# Altium project RK3566_.PrjPcb (part 5 of 6)

## Sheet 以太网 PHY_以太网_WIFIBT IO.schdoc
size 297 x 209 mm; Symbol: Drawing-Symbol_A4; Company: 嘉立创EDA; Version: V1.0; Page Size: A4; @Project Name: RK3566; @Update Date: 2026-10-03; @Create Date: 2026-05-25; Device: Drawing-Symbol_A4; @Board Name: Board1; @Page Name: P2; @Create Time: 23:14:39; @Page Count: 5; @Page No: 5; @Schematic Name: Schematic1; @Update Time: 23:14:39; @Assembly Variant: Basic; Border: 1; Title Block Position: 3; Size: A4; Width: 1170; Height: 825; Region Start: 1; X Region Count: 6; Y Region Count: 4; Blade Width: 10; SheetNumber: 10; SheetTotal: 11
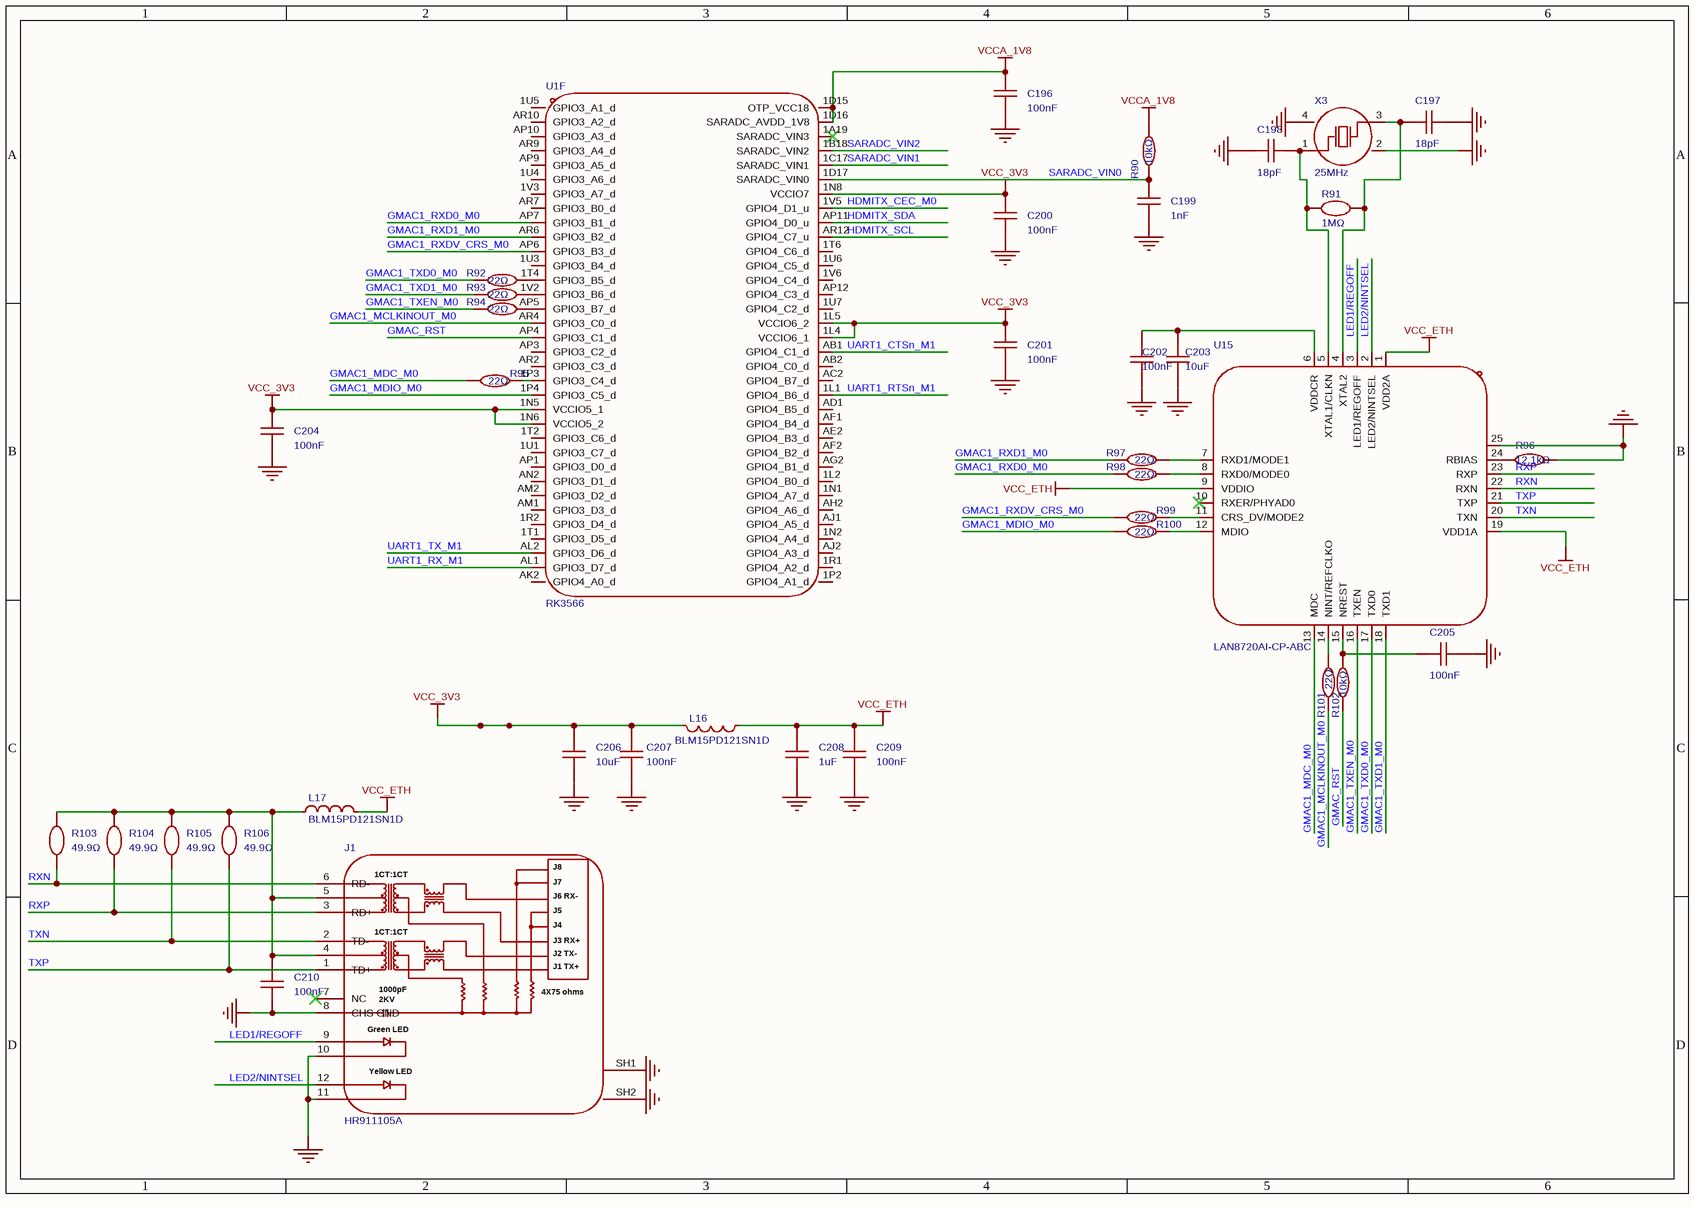
[diagram p11: 以太网 PHY_以太网_WIFIBT IO.schdoc]

### Parts
C196  100nF  [C0201]
C197  18pF  [C0402]
C198  18pF  [C0402]
C199  1nF  [C0402]
C200  100nF  [C0201]
C201  100nF  [C0201]
C202  100nF  [C0402]
C203  10uF  [C0402]
C204  100nF  [C0201]
C205  100nF  [C0402]
C206  10uF  [C0402]
C207  100nF  [C0402]
C208  1uF  [C0402]
C209  100nF  [C0402]
C210  100nF  [C0402]
J1  HR911105A  [RJ45-TH_HR911105A]
L16  BLM15PD121SN1D  [L0402]
L17  BLM15PD121SN1D  [L0402]
R90  10kΩ  [R0402]
R91  1MΩ  [R0402]
R92  22Ω  [R0402]
R93  22Ω  [R0402]
R94  22Ω  [R0402]
R95  22Ω  [R0402]
R96  12.1kΩ  [R0402]
R97  22Ω  [R0402]
R98  22Ω  [R0402]
R99  22Ω  [R0402]
R100  22Ω  [R0402]
R101  22Ω  [R0402]
R102  10kΩ  [R0402]
R103  49.9Ω  [R0402]
R104  49.9Ω  [R0402]
R105  49.9Ω  [R0402]
R106  49.9Ω  [R0402]
U1  RK3566  [BGA-565_L15.5-W14.4-P0.40_RK3566_1]  (part F of 8)
U15  LAN8720AI-CP-ABC  [QFN-24_L4.0-W4.0-P0.50-BL-EP2.6]
X3  25MHz  [CRYSTAL-SMD_4P-L3.2-W2.5-BL]

### Nets
GND: C196.1 C197.2 C198.1 C199.1 C200.1 C201.1 C202.1 C203.1 C204.1 C205.1 C206.1 C207.1 C208.1 C209.2 C210.2 J1.8(CHS_GND) J1.10 J1.11 J1.SH1 J1.SH2 R96.2 U15.25(PAD) X3.2(GND) X3.4(GND)  [project net AVSS1_1]
VCC_3V3: C200.2 C201.2 C204.2 C206.2 C207.2 L16.2 U1.1L4(VCCIO6_1) U1.1L5(VCCIO6_2) U1.1N5(VCCIO5_1) U1.1N6(VCCIO5_2) U1.1N8(VCCIO7)  [project net SWOUT1]
VCC_ETH: C208.2 C209.1 L16.1 L17.2 U15.1(VDD2A) U15.9(VDDIO) U15.19(VDD1A)
VCCA_1V8: C196.2 R90.1 U1.1D15(OTP_VCC18) U1.1D16(SARADC_AVDD_1V8)  [project net LDO7]
GMAC1_MCLKINOUT_M0: R101.1 U1.AR4(GPIO3_C0_d)
GMAC1_MDC_M0: R95.2 U15.13(MDC)
GMAC1_MDIO_M0: R100.2 U1.1P4(GPIO3_C5_d)
GMAC1_RXD0_M0: R98.1 U1.AP7(GPIO3_B1_d)
GMAC1_RXD1_M0: R97.1 U1.AR6(GPIO3_B2_d)
GMAC1_RXDV_CRS_M0: R99.2 U1.AP6(GPIO3_B3_d)
GMAC1_TXD0_M0: R92.1 U15.17(TXD0)
GMAC1_TXD1_M0: R93.1 U15.18(TXD1)
GMAC1_TXEN_M0: R94.1 U15.16(TXEN)
GMAC_RST: R102.2 U1.AP4(GPIO3_C1_d)
HDMITX_CEC_M0: U1.1V5(GPIO4_D1_u)
HDMITX_SCL: U1.AR12(GPIO4_C7_u)
HDMITX_SDA: U1.AP11(GPIO4_D0_u)
LED1/REGOFF: J1.9 U15.3(LED1/REGOFF)
LED2/NINTSEL: J1.12 U15.2(LED2/NINTSEL)
RXN: J1.6(RD-) R103.1 U15.22(RXN)
RXP: J1.3(RD+) R104.1 U15.23(RXP)
SARADC_VIN0: C199.2 R90.2 U1.1D17(SARADC_VIN0)
SARADC_VIN1: U1.1C17(SARADC_VIN1)
SARADC_VIN2: U1.1B18(SARADC_VIN2)
TXN: J1.2(TD-) R105.1 U15.20(TXN)
TXP: J1.1(TD+) R106.1 U15.21(TXP)
UART1_CTSn_M1: U1.AB1(GPIO4_C1_d)
UART1_RTSn_M1: U1.1L1(GPIO4_B6_d)
UART1_RX_M1: U1.AL1(GPIO3_D7_d)
UART1_TX_M1: U1.AL2(GPIO3_D6_d)
NetC197_1: C197.1 R91.2 U15.4(XTAL2) X3.3(OSC2)
NetC198_2: C198.2 R91.1 U15.5(XTAL1/CLKN) X3.1(OSC1)
NetC202_2: C202.2 C203.2 U15.6(VDDCR)
NetC205_2: C205.2 R102.1 U15.15(NREST)
NetC210_1: C210.1 J1.4 J1.5 L17.1 R103.2 R104.2 R105.2 R106.2
NetR92_2: R92.2 U1.1T4(GPIO3_B5_d)
NetR93_2: R93.2 U1.1V2(GPIO3_B6_d)
NetR94_2: R94.2 U1.AP5(GPIO3_B7_d)
NetR95_1: R95.1 U1.1P3(GPIO3_C4_d)
NetR96_1: R96.1 U15.24(RBIAS)
NetR97_2: R97.2 U15.7(RXD1/MODE1)
NetR98_2: R98.2 U15.8(RXD0/MODE0)
NetR99_1: R99.1 U15.11(CRS_DV/MODE2)
NetR100_1: R100.1 U15.12(MDIO)
NetR101_2: R101.2 U15.14(NINT/REFCLKO)

Not connected (* = marked no-connect by the designer): J1 7(NC)*; U1 1A19(SARADC_VIN3)* 1L2(GPIO4_B0_d) 1N1(GPIO4_A7_d) 1N2(GPIO4_A4_d) 1P2(GPIO4_A1_d) 1R1(GPIO4_A2_d) 1R2(GPIO3_D4_d) 1T1(GPIO3_D5_d) 1T2(GPIO3_C6_d) 1T6(GPIO4_C6_d) 1U1(GPIO3_C7_d) 1U3(GPIO3_B4_d) 1U4(GPIO3_A6_d) 1U5(GPIO3_A1_d) 1U6(GPIO4_C5_d) 1U7(GPIO4_C2_d) 1V3(GPIO3_A7_d) 1V6(GPIO4_C4_d) AB2(GPIO4_C0_d) AC2(GPIO4_B7_d) AD1(GPIO4_B5_d) AE2(GPIO4_B3_d) AF1(GPIO4_B4_d) AF2(GPIO4_B2_d) AG2(GPIO4_B1_d) AH2(GPIO4_A6_d) AJ1(GPIO4_A5_d) AJ2(GPIO4_A3_d) AK2(GPIO4_A0_d) AM1(GPIO3_D3_d) AM2(GPIO3_D2_d) AN2(GPIO3_D1_d) AP1(GPIO3_D0_d) AP3(GPIO3_C2_d) AP9(GPIO3_A5_d) AP10(GPIO3_A3_d) AP12(GPIO4_C3_d) AR2(GPIO3_C3_d) AR7(GPIO3_B0_d) AR9(GPIO3_A4_d) AR10(GPIO3_A2_d); U15 10(RXER/PHYAD0)*

### Notes on the sheet
- 创建日期
- 2026-10-03
- 原理图
- 板子
- Schematic1
- Board1
- 更新日期
- 图页
- P2
- 绘制
- 审阅
- RK3566
- 版本
- V1.0
- 尺寸
- A4
- 页    5    共    5
- 嘉立创EDA
- (in symbol HR911105A_C12074) J8; 1CT:1CT; J7; J6 RX-; J5; J4; J3 RX+; J2 TX-; J1 TX+; 1000pF; 4X75 ohms; 2KV; Green LED; Yellow LED

### Library data of the parts
C196 C200 C201 C204 = GRM033R61E104KE14D: 容值:100nF;精度:±10%;额定电压:25V;温度系数:X5R;; Manufacturer: muRata(村田); 3D Model: e8033a7cb35143ffb28e3b81b2577ea0聨0819f05c4eef4c71ace90d822a990e87; 3D Model Transform: 23.622,11.811,0,0,0,0,0,0,0; Tolerance: ±10%; Voltage Rating: 25V; Temperature Coefficient: X5R; AddInBom: yes; ModelName: C0201_L0.6-W0.3-H0.3; Symbol: GRM033R61E104KE14D; Device: GRM033R61E104KE14D; LCSC Part Name: 100nF ±10% 25V; Supplier Part: C76939; Manufacturer Part: GRM033R61E104KE14D; Supplier Footprint: 0201; JLCPCB Part Class: Extended Part; Datasheet: https://item.szlcsc.com/datasheet/GRM033R61E104KE14D/78066.html; Supplier: LCSC; Value: 100nF; ConvertToPcb: yes; FootprintName: C0201
C197 C198 = FCC0402N180J500AT: 容值:18pF;精度:±5%;额定电压:50V;温度系数:C0G;; Manufacturer: FOJAN(富捷); 3D Model: 36a51122f27c49738f86b3bfa98863e0聨0819f05c4eef4c71ace90d822a990e87; 3D Model Transform: 39.37,19.685,0,0,0,0,0,0,0; Tolerance: ±5%; Voltage Rating: 50V; Temperature Coefficient: C0G; AddInBom: yes; ModelName: C0402_L1.0-W0.5-H0.5; Symbol: FCC0402N180J500AT; Device: FCC0402N180J500AT; LCSC Part Name: 18pF ±5% 50V; Supplier Part: C5137554; Manufacturer Part: FCC0402N180J500AT; Supplier Footprint: 0402; JLCPCB Part Class: Extended Part; Datasheet: https://item.szlcsc.com/datasheet/FCC0402N180J500AT/5747006.html; Supplier: LCSC; Value: 18pF; Operating Temperature: -55℃~+125℃; ConvertToPcb: yes; FootprintName: C0402
C199 = CC0402KRX7R9BB102: 容值:1nF;精度:±10%;额定电压:50V;材质(温度系数):X7R;; Manufacturer: YAGEO(国巨); AddInBom: yes; ModelId: 36a51122f27c49738f86b3bfa98863e0聨0819f05c4eef4c71ace90d822a990e87; ModelName: C0402_L1.0-W0.5-H0.5; ModelTransform: 39.37,19.685,0,0,0,0,0,0,0; Tolerance: ±10%; Voltage Rated: 50V; Temperature Coefficient: X7R; Symbol: CC0402KRX7R9BB102; Device: CC0402KRX7R9BB102; LCSC Part Name: 1nF ±10% 50V; SupplierPart: C106205; ManufacturerPart: CC0402KRX7R9BB102; Supplier Footprint: 0402; JLCPCB Part Class: Extended Part; Datasheet: https://atta.szlcsc.com/upload/public/pdf/source/20181008/C309510_22F155564471FAF6A489F7D68F34234E.pdf; Supplier: LCSC; ConvertToPcb: yes; FootprintName: C0402; Value: 1nF
C202 C205 C207 C209 C210 = CL05B104KO5NNNC: as C113 on sheet WIFI_BT PHY; Symbol: CL05B104KO5NNNC; Device: CL05B104KO5NNNC; LCSC Part Name: 100nF ±10% 16V; Supplier Part: C1525; Manufacturer Part: CL05B104KO5NNNC; Supplier Footprint: 0402; JLCPCB Part Class: Basic Part; Datasheet: https://item.szlcsc.com/datasheet/CL05B104KO5NNNC/1877.html; Supplier: LCSC; Value: 100nF; ConvertToPcb: yes; FootprintName: C0402
C203 C206 = HGC0402R5106M100NTEJ: as C118 on sheet WIFI_BT PHY; Symbol: HGC0402R5106M100NTEJ; Device: HGC0402R5106M100NTEJ; LCSC Part Name: 10uF ±20% 10V; Supplier Part: C7472949; Manufacturer Part: HGC0402R5106M100NTEJ; Supplier Footprint: 0402; JLCPCB Part Class: Extended Part; Datasheet: https://item.szlcsc.com/datasheet/HGC0402R5106M100NTEJ/8532796.html; Supplier: LCSC; Value: 10uF; ConvertToPcb: yes; FootprintName: C0402
C208 = HGC0402R5105K500NTEJ: as C112 on sheet WIFI_BT PHY; Symbol: HGC0402R5105K500NTEJ; Device: HGC0402R5105K500NTEJ; LCSC Part Name: 1uF ±10% 50V; Supplier Part: C7472948; Manufacturer Part: HGC0402R5105K500NTEJ; Supplier Footprint: 0402; JLCPCB Part Class: Extended Part; Datasheet: https://item.szlcsc.com/datasheet/HGC0402R5105K500NTEJ/8532795.html; Supplier: LCSC; Value: 1uF; ConvertToPcb: yes; FootprintName: C0402
J1 = HR911105A_C12074: 连接器类型:RJ45插座;安装方式:弯插;端口数量:1;LED:带LED;屏蔽:有屏蔽;等级:-;触头材质:磷青铜;触头镀层:金;工作温度:0℃~+70℃;; Manufacturer: HANRUN(汉仁); AddInBom: yes; ModelId: 269ece015cf14129b359f9a66aa2dc0d聨0819f05c4eef4c71ace90d822a990e87; ModelTransform: 624.711,850.392,0,0,0,0,0,-89.567,-129.921; Connector Type: RJ45插座; Number of Ports: 1; LED: 带LED; Shielding: 有屏蔽; PoE: 不带PoE; Supplementary Features: 带滤波; Symbol: HR911105A_C12074; Device: HR911105A_C12074; LCSC Part Name: 弯插 带LED; SupplierPart: C12074; ManufacturerPart: HR911105A; Supplier Footprint: 插件; JLCPCB Part Class: Extended Part; Datasheet: https://item.szlcsc.com/datasheet/HR911105A/12651.html; Supplier: LCSC; ConvertToPcb: yes; FootprintName: RJ45-TH_HR911105A; ModelName: RJ45-TH_HR911105A; Mounting Type: 弯插; Ratings: -; Contact Material: 磷青铜; Contact Plating: 金; Operating Temperature: 0℃~+70℃; Length: 21.3mm; Width: 16.04mm; Height: 13.5mm
L16 L17 = BLM15PD121SN1D: as L13 on sheet 扬声器_麦克风; Symbol: BLM15PD121SN1D; Device: BLM15PD121SN1D; LCSC Part Name: 单路 0402磁珠 阻抗120Ω@100MHz; SupplierPart: C76891; ManufacturerPart: BLM15PD121SN1D; Supplier Footprint: 0402; JLCPCB Part Class: Extended Part; Datasheet: https://item.szlcsc.com/datasheet/BLM15PD121SN1D/78018.html; Supplier: LCSC; ConvertToPcb: yes; FootprintName: L0402; Impedance @ Frequency: 120Ω@100MHz; Operating Temperature: -55℃~+125℃
R90 R102 = CRCW040210K0FKED: 电阻类型:厚膜电阻;阻值:10kΩ;精度:±1%;功率:63mW;温度系数:±100ppm/K;最大工作电压:50V;工作温度范围:-55℃~+155℃;; Manufacturer: VISHAY(威世); 3D Model: 671aefced39d4c318694bba8bd8efd39; 3D Model Transform: 39.37,19.685,0,0,0,0,0,0.0005,0; Tolerance: ±1%; Power(Watts): 63mW; Overload Voltage (Max): 50V; AddInBom: yes; ModelName: R0402_L1.0-W0.5-H0.5; Symbol: CRCW040210K0FKED; Device: CRCW040210K0FKED; LCSC Part Name: 10kΩ ±1% 63mW; Supplier Part: C71617; Manufacturer Part: CRCW040210K0FKED; Supplier Footprint: 0402; JLCPCB Part Class: 扩展库; Datasheet: https://atta.szlcsc.com/upload/public/pdf/source/20180224/C71617_15194370300791364062.pdf; Supplier: LCSC; Type: 厚膜电阻; Value: 10kΩ; Temperature Coefficient: ±100ppm/K; Operating Temperature Range: -55℃~+155℃; ConvertToPcb: yes; FootprintName: R0402
R91 = FRC0402J105 TS: 电阻类型:厚膜电阻;阻值:1MΩ;精度:±5%;功率:62.5mW;工作电压:50V;温度系数:±100ppm/℃;; Manufacturer: FOJAN(富捷); AddInBom: yes; ModelId: 98c88bc2b9094f218f3a3e30a7012738聨0819f05c4eef4c71ace90d822a990e87; ModelName: R0402_L1.0-W0.5-H0.4; ModelTransform: 39.37,19.685,0,0,0,0,0,0,0; Tolerance: ±5%; Power(Watts): 62.5mW; Voltage-Supply(Max): 50V; Symbol: FRC0402J105 TS; Device: FRC0402J105 TS; LCSC Part Name: 1MΩ ±5% 62.5mW 厚膜电阻; SupplierPart: C2906900; ManufacturerPart: FRC0402J105 TS; Supplier Footprint: 0402; JLCPCB Part Class: Extended Part; Supplier: LCSC; ConvertToPcb: yes; FootprintName: R0402; Type: 厚膜电阻; Value: 1MΩ; Temperature Coefficient: ±100ppm/℃; Operating Temperature: -55℃~+155℃
R92-R95 R97-R101 = 0402WGF220JTCE: as R86 on sheet 串口 PHY; Symbol: 0402WGF220JTCE; Device: 0402WGF220JTCE; LCSC Part Name: 22Ω ±1% 62.5mW 厚膜电阻; SupplierPart: C25092; ManufacturerPart: 0402WGF220JTCE; Supplier Footprint: 0402; JLCPCB Part Class: Basic Part; Datasheet: https://atta.szlcsc.com/upload/public/pdf/source/20200306/C422600_1E6D84923E4A46A82E41ADD87F860B5C.pdf; Supplier: LCSC; ConvertToPcb: yes; FootprintName: R0402; Type: 厚膜电阻; Value: 22Ω; Temperature Coefficient: ±100ppm/℃; Operating Temperature Range: -55℃~+155℃
R96 = RC-02K1212FT: 电阻类型:厚膜电阻;阻值:12.1kΩ;精度:±1%;功率:62.5mW;最大工作电压:50V;温度系数:±100ppm/℃;; Manufacturer: FH(风华); Symbol: RS-02K1212FT; AddInBom: yes; ModelId: 98c88bc2b9094f218f3a3e30a7012738聨0819f05c4eef4c71ace90d822a990e87; ModelName: R0402_L1.0-W0.5-H0.4; ModelTransform: 39.37,19.685,0,0,0,0,0,0,0; Tolerance: ±1%; Power(Watts): 62.5mW; Overload Voltage (Max): 50V; Device: RC-02K1212FT; LCSC Part Name: 厚膜电阻 12.1kΩ ±1% 62.5mW; SupplierPart: C140207; ManufacturerPart: RC-02K1212FT; Supplier Footprint: 0402; JLCPCB Part Class: Extended Part; Datasheet: https://atta.szlcsc.com/upload/public/pdf/source/20140616/1457707091974.pdf; Supplier: LCSC; ConvertToPcb: yes; FootprintName: R0402; Type: 厚膜电阻; Value: 12.1kΩ; Temperature Coefficient: ±100ppm/℃; Operating Temperature Range: -55℃~+155℃
R103-R106 = FRC0402F49R9TS: 电阻类型:厚膜电阻;阻值:49.9Ω;精度:±1%;功率:62.5mW;工作电压:50V;温度系数:±100ppm/℃;; Manufacturer: FOJAN(富捷); AddInBom: yes; ModelId: 98c88bc2b9094f218f3a3e30a7012738聨0819f05c4eef4c71ace90d822a990e87; ModelName: R0402_L1.0-W0.5-H0.4; ModelTransform: 39.37,19.685,0,0,0,0,0,0,0; Tolerance: ±1%; Power(Watts): 62.5mW; Voltage-Supply(Max): 50V; Symbol: FRC0402F49R9TS; Device: FRC0402F49R9TS; LCSC Part Name: 49.9Ω ±1% 62.5mW 厚膜电阻; SupplierPart: C2933103; ManufacturerPart: FRC0402F49R9TS; Supplier Footprint: 0402; JLCPCB Part Class: Extended Part; Supplier: LCSC; ConvertToPcb: yes; FootprintName: R0402; Type: 厚膜电阻; Value: 49.9Ω; Temperature Coefficient: ±100ppm/℃; Operating Temperature: -55℃~+155℃
U1 = RK3566: 是一款高性能、低功耗的四核应用处理器，专为个人移动互联网设备和AIoT设备设计。提供了许多嵌入式强大硬件引擎，以优化高端应用的性能。支持几乎全格式的H.264 4K@60fps解码器、H.265 4K@60fps解码器，还支持H.264/H.265 1080p@60fps编码器、高质量JPEG编码器/解码器。嵌入式3D GPU使其完全兼容OpenGL ES 1.1/2.0/3.2、OpenCL 2.0和Vulkan 1.1; Manufacturer: Rockchip(瑞芯微); Relevance: []; 3D Model: 096be4498db445d8b521581a084e15ec聨0819f05c4eef4c71ace90d822a990e87; 3D Model Transform: 610.235,566.928,0,0,0,0,0,0,0; AddInBom: yes; Symbol: RK3566; Device: RK3566; LCSC Part Name: 表面贴装型开关全行程、动作力等性能; Supplier Part: C2943786; Manufacturer Part: RK3566; Supplier Footprint: BGA-565(15.5x14.4); JLCPCB Part Class: Extended Part; Datasheet: https://item.szlcsc.com/datasheet/RK3566/3329057.html; Supplier: LCSC; ConvertToPcb: yes; FootprintName: BGA-565_L15.5-W14.4-P0.40_RK3566_1; ModelName: BGA-565_L15.5-W14.4-P0.40_RK3566_1
U15 = LAN8720AI-CP-ABC: 输入类型:施密特触发器;工作电压:1.6V~3.6V;元件数:-;每个元件位数:-;灌电流(IOL):12mA;拉电流(IOH):12mA;; Manufacturer: MICROCHIP(美国微芯); AddInBom: yes; ModelId: 1e6a51e223ba431598528b34e5bdfcc9聨0819f05c4eef4c71ace90d822a990e87; ModelName: QFN-24_L4.0-W4.0-H0.9-P0.50; ModelTransform: 157.48,157.48,0,90,0,0,0,0,0; Input type: 施密特触发器; Current - Output Low(IOL): 12mA; Symbol: LAN8720AI-CP-ABC; Device: LAN8720AI-CP-ABC; LCSC Part Name: 支持HP自动MDIX功能的小尺寸RMII 10/100以太网收发器; SupplierPart: C511283; ManufacturerPart: LAN8720AI-CP-ABC; Supplier Footprint: QFN-24-EP(4x4); JLCPCB Part Class: Extended Part; Datasheet: https://item.szlcsc.com/datasheet/LAN8720AI-CP-ABC/525730.html; Supplier: LCSC; ConvertToPcb: yes; FootprintName: QFN-24_L4.0-W4.0-P0.50-BL-EP2.6; output type: -; Voltage - Supply: 1.6V~3.6V; Number of Elements: -; Number of Bits per Element: -; Channel Type: -; Current - Output High(IOH): 12mA; Logic Family: LAN8720A; Operating Temperature: -40℃~+85℃; Quiescent Current: -; Propagation Delay: -; Features: -
X3 = X322525MOB4SI: 晶振类型:贴片晶振;频率:25MHz;常温频差:±10ppm;负载电容:12pF;频率稳定度:±20ppm;; Manufacturer: YXC(扬兴晶振); AddInBom: yes; ModelId: ff2dfd5650294453a14147960efe1838聨0819f05c4eef4c71ace90d822a990e87; ModelTransform: 125.984,98.425,0,0,0,0,0,0,0; Normal temperature Frequency Tolerance: ±10ppm; Load Capacitance: 12pF; Frequency Stability: ±20ppm; Equivalent Series Resistance(ESR): 50Ω; Symbol: X322525MOB4SI; Device: X322525MOB4SI; LCSC Part Name: YSX321SL 25MHZ 4P 3225 12PF ±10PPM -40~85℃ (±20PPM); SupplierPart: C9006; ManufacturerPart: X322525MOB4SI; Supplier Footprint: SMD3225-4P; JLCPCB Part Class: Basic Part; Datasheet: https://item.szlcsc.com/datasheet/X322525MOB4SI/9526.html; Supplier: LCSC; ConvertToPcb: yes; FootprintName: CRYSTAL-SMD_4P-L3.2-W2.5-BL; ModelName: CRYSTAL-SMD_4P-L3.2-W2.5-BL; Type: 贴片晶振; Value: 25MHz; Operating Temperature: -40℃~+85℃

## Sheet 引出引脚_螺纹孔.schdoc
size 297 x 209 mm; Symbol: Drawing-Symbol_A4; Company: 嘉立创EDA; Version: V1.0; Page Size: A4; @Project Name: RK3566; @Update Date: 2026-10-06; @Create Date: 2026-05-27; Device: Drawing-Symbol_A4; @Board Name: Board1; @Page Name: P2; @Create Time: 12:07:08; @Page Count: 10; @Page No: 0; @Schematic Name: Schematic1; @Update Time: 12:07:08; @Assembly Variant: Basic; Border: 1; Title Block Position: 3; Size: A4; Width: 1170; Height: 825; Region Start: 1; X Region Count: 6; Y Region Count: 4; Blade Width: 10; SheetNumber: 11; SheetTotal: 11
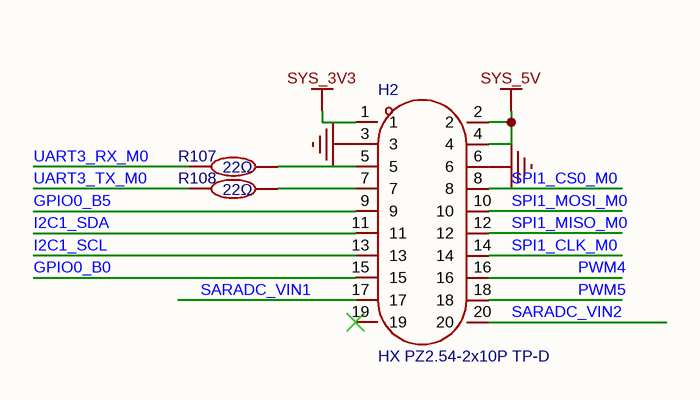
[diagram p12: 引出引脚_螺纹孔.schdoc]

### Parts
H2  HX PZ2.54-2x10P TP-D  [HDR-SMD_20P-P2.54-V-M-R2-C10-S2.54-LS7.5-EH]
R107  22Ω  [R0402]
R108  22Ω  [R0402]

### Nets
GND: H2.3 H2.6  [project net AVSS1_1]
SYS_3V3: H2.1
SYS_5V: H2.2 H2.4
GPIO0_B0: H2.15
GPIO0_B5: H2.9
I2C1_SCL: H2.13
I2C1_SDA: H2.11
PWM4: H2.16
PWM5: H2.18
SARADC_VIN1: H2.17
SARADC_VIN2: H2.20
SPI1_CLK_M0: H2.14
SPI1_CS0_M0: H2.8
SPI1_MISO_M0: H2.12
SPI1_MOSI_M0: H2.10
UART3_RX_M0: R107.1
UART3_TX_M0: R108.1
NetH2_5: H2.5 R107.2
NetH2_7: H2.7 R108.2

Not connected (* = marked no-connect by the designer): H2 19*

### Notes on the sheet
- 创建日期
- 2026-10-06
- 原理图
- 板子
- Schematic1
- Board1
- 更新日期
- 图页
- P2
- 绘制
- 审阅
- RK3566
- 版本
- V1.0
- 尺寸
- A4
- 页    0    共    10
- 嘉立创EDA

### Library data of the parts
H2 = HX PZ2.54-2x10P TP-D: 插针结构:2x10P;间距:2.54mm;行距:2.54mm;圆针/方针:方针;安装方式:立贴;排数:双排;总PIN位数:20P;额定电流:3A;额定电压:1kV;配合针长度:6mm;塑高:2.5mm;端接针长度:-;触头材质:黄铜;触头镀层:金;工作温度:-40℃~+105℃;颜色:黑色;; Manufacturer: hanxia(韩下); AddInBom: yes; ModelId: 2f2e403eed2245bd8cccf105df6707d7聨0819f05c4eef4c71ace90d822a990e87; ModelTransform: 1000.39166,295.275,0,0,0,0,0,0,-27.559; Pin Structure: 2x10P; Pitch: 2.54mm; Circluar Pins/Square Pins: 方针; Current Rating: 3A; Voltage Rating (Max): 1kV; Symbol: HX PZ2.54-2X10P TP-D; Device: HX PZ2.54-2x10P TP-D; LCSC Part Name: 配套排母HX PM2.54-2x10P系列 2x10P 间距:2.54mm 方针 立贴; SupplierPart: C46061674; ManufacturerPart: HX PZ2.54-2x10P TP-D; Supplier Footprint: SMD,P=2.54mm; JLCPCB Part Class: Extended Part; Datasheet: https://item.szlcsc.com/datasheet/HX%2520PZ2.54-2x10P%2520TP-D/48170534.html; Supplier: LCSC; ConvertToPcb: yes; FootprintName: HDR-SMD_20P-P2.54-V-M-R2-C10-S2.54-LS7.5-EH; ModelName: HDR-SMD_20P-P2.54-V-M-R2-C10-S2.54-LS7.5-EH; Row Spacing: 2.54mm; Mounting Type: 立贴; Number of Rows: 双排; Number of Pins: 20P; Length of Mating Pin: 6mm; Insulation Height: 2.5mm; Length of End Connection Pin: -; Contact Material: 黄铜; Contact Plating: 金; Operating Temperature: -40℃~+105℃; Color: 黑色; Supplementary Features: -
R107 R108 = RC0402FR-0722RL: as R51-R55 on sheet WIFI_BT PHY; Symbol: RC0402FR-0722RL; Device: RC0402FR-0722RL; LCSC Part Name: 厚膜电阻 22Ω ±1% 62.5mW; Supplier Part: C114765; Manufacturer Part: RC0402FR-0722RL; Supplier Footprint: 0402; JLCPCB Part Class: Extended Part; Datasheet: https://item.szlcsc.com/datasheet/RC0402FR-0722RL/116009.html; Supplier: LCSC; Type: 厚膜电阻; Value: 22Ω; Temperature Coefficient: ±100ppm/℃; Operating Temperature: -55℃~+155℃; ConvertToPcb: yes; FootprintName: R0402